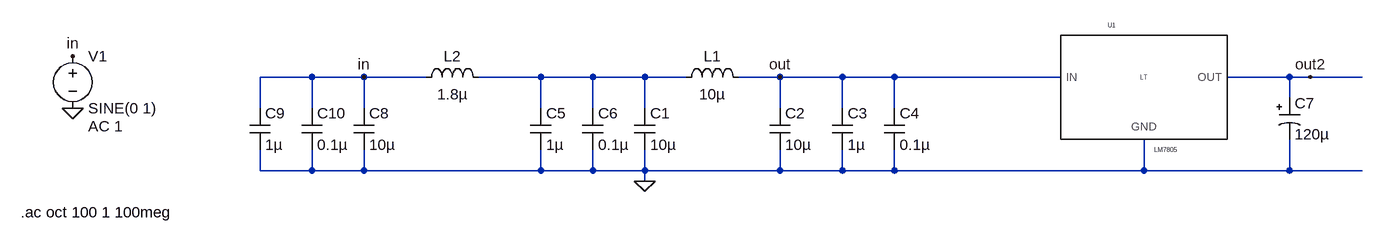
[diagram p0: schematic CLC_pi_filter.asc]
CLC_pi_filter.asc, the LTspice schematic file:
Version 4
SHEET 1 1236 680
WIRE -384 80 -464 80
WIRE -304 80 -384 80
WIRE -208 80 -304 80
WIRE -32 80 -128 80
WIRE 48 80 -32 80
WIRE 128 80 48 80
WIRE 192 80 128 80
WIRE 336 80 272 80
WIRE 432 80 336 80
WIRE 512 80 432 80
WIRE 768 80 512 80
WIRE 1120 80 1024 80
WIRE 1152 80 1120 80
WIRE 1232 80 1152 80
WIRE 1120 112 1120 80
WIRE -464 128 -464 80
WIRE -384 128 -384 80
WIRE -304 128 -304 80
WIRE -32 128 -32 80
WIRE 48 128 48 80
WIRE 128 128 128 80
WIRE 336 128 336 80
WIRE 432 128 432 80
WIRE 512 128 512 80
WIRE -464 224 -464 192
WIRE -384 224 -384 192
WIRE -384 224 -464 224
WIRE -304 224 -304 192
WIRE -304 224 -384 224
WIRE -32 224 -32 192
WIRE -32 224 -304 224
WIRE 48 224 48 192
WIRE 48 224 -32 224
WIRE 128 224 128 192
WIRE 128 224 48 224
WIRE 336 224 336 192
WIRE 336 224 128 224
WIRE 432 224 432 192
WIRE 432 224 336 224
WIRE 512 224 512 192
WIRE 512 224 432 224
WIRE 896 224 896 176
WIRE 896 224 512 224
WIRE 1120 224 1120 176
WIRE 1120 224 896 224
WIRE 1232 224 1120 224
WIRE 128 240 128 224
FLAG 128 240 0
FLAG 336 80 out
FLAG -752 128 0
FLAG -752 48 in
FLAG 1152 80 out2
FLAG -304 80 in
SYMBOL cap 112 128 R0
SYMATTR InstName C1
SYMATTR Value 10µ
SYMATTR SpiceLine V=10 Irms=7.86 Rser=0.00457925 Lser=0 mfg="KEMET" pn="C1206C106K8RAC" type="X7R"
SYMBOL ind 176 96 R270
WINDOW 0 32 56 VTop 2
WINDOW 3 5 56 VBottom 2
SYMATTR InstName L1
SYMATTR Value 10µ
SYMATTR SpiceLine Ipk=1.44 Rser=0.1 Rpar=0 Cpar=0
SYMBOL cap 320 128 R0
SYMATTR InstName C2
SYMATTR Value 10µ
SYMATTR SpiceLine V=10 Irms=13.8 Rser=0.00468332 Lser=0 mfg="KEMET" pn="C1210C106K8RAC" type="X7R"
SYMBOL voltage -752 32 R0
WINDOW 123 24 124 Left 2
WINDOW 39 0 0 Left 2
SYMATTR InstName V1
SYMATTR Value SINE(0 1)
SYMATTR Value2 AC 1
SYMBOL cap 416 128 R0
SYMATTR InstName C3
SYMATTR Value 1µ
SYMATTR SpiceLine V=10 Irms=5.18 Rser=0.0171188 Lser=0 mfg="KEMET" pn="C0603C105K8PAC" type="X5R"
SYMBOL cap 496 128 R0
SYMATTR InstName C4
SYMATTR Value 0.1µ
SYMATTR SpiceLine V=10 Irms=728m Rser=0.14361 Lser=0 mfg="KEMET" pn="C0603C104K8RAC" type="X7R"
SYMBOL cap -48 128 R0
SYMATTR InstName C5
SYMATTR Value 1µ
SYMATTR SpiceLine V=10 Irms=5.18 Rser=0.0171188 Lser=0 mfg="KEMET" pn="C0603C105K8PAC" type="X5R"
SYMBOL cap 32 128 R0
SYMATTR InstName C6
SYMATTR Value 0.1µ
SYMATTR SpiceLine V=10 Irms=728m Rser=0.14361 Lser=0 mfg="KEMET" pn="C0603C104K8RAC" type="X7R"
SYMBOL my\\7805 896 80 R0
SYMATTR InstName U1
SYMBOL polcap 1104 112 R0
WINDOW 3 24 56 Left 2
SYMATTR InstName C7
SYMATTR Value 120µ
SYMATTR Description Capacitor
SYMATTR Type cap
SYMATTR SpiceLine V=63 Irms=750m Rser=0.12 Lser=0 mfg="Nichicon" pn="UPL1J121MRH6" type="Al electrolytic"
SYMBOL ind -224 96 R270
WINDOW 0 32 56 VTop 2
WINDOW 3 5 56 VBottom 2
SYMATTR InstName L2
SYMATTR Value 1.8µ
SYMATTR SpiceLine Ipk=2.91 Rser=0.042 Rpar=0 Cpar=0 mfg="Sumida" pn="CD43-1R8"
SYMBOL cap -320 128 R0
SYMATTR InstName C8
SYMATTR Value 10µ
SYMATTR SpiceLine V=10 Irms=7.86 Rser=0.00457925 Lser=0 mfg="KEMET" pn="C1206C106K8RAC" type="X7R"
SYMBOL cap -480 128 R0
SYMATTR InstName C9
SYMATTR Value 1µ
SYMATTR SpiceLine V=10 Irms=5.18 Rser=0.0171188 Lser=0 mfg="KEMET" pn="C0603C105K8PAC" type="X5R"
SYMBOL cap -400 128 R0
SYMATTR InstName C10
SYMATTR Value 0.1µ
SYMATTR SpiceLine V=10 Irms=728m Rser=0.14361 Lser=0 mfg="KEMET" pn="C0603C104K8RAC" type="X7R"
TEXT -832 288 Left 2 !.ac oct 100 1 100meg

The netlist it stands for:
* CLC_pi_filter.asc
C1 N001 0 10µ V=10 Irms=7.86 Rser=0.00457925 Lser=0 mfg="KEMET" pn="C1206C106K8RAC" type="X7R"
L1 N001 out 10µ Ipk=1.44 Rser=0.1 Rpar=0 Cpar=0
C2 out 0 10µ V=10 Irms=13.8 Rser=0.00468332 Lser=0 mfg="KEMET" pn="C1210C106K8RAC" type="X7R"
V1 in 0 SINE(0 1) AC 1
C3 out 0 1µ V=10 Irms=5.18 Rser=0.0171188 Lser=0 mfg="KEMET" pn="C0603C105K8PAC" type="X5R"
C4 out 0 0.1µ V=10 Irms=728m Rser=0.14361 Lser=0 mfg="KEMET" pn="C0603C104K8RAC" type="X7R"
C5 N001 0 1µ V=10 Irms=5.18 Rser=0.0171188 Lser=0 mfg="KEMET" pn="C0603C105K8PAC" type="X5R"
C6 N001 0 0.1µ V=10 Irms=728m Rser=0.14361 Lser=0 mfg="KEMET" pn="C0603C104K8RAC" type="X7R"
XU1 out 0 out2 LM7805  ; pins IN GND OUT
C7 out2 0 120µ V=63 Irms=750m Rser=0.12 Lser=0 mfg="Nichicon" pn="UPL1J121MRH6" type="Al electrolytic"
L2 in N001 1.8µ Ipk=2.91 Rser=0.042 Rpar=0 Cpar=0 mfg="Sumida" pn="CD43-1R8"
C8 in 0 10µ V=10 Irms=7.86 Rser=0.00457925 Lser=0 mfg="KEMET" pn="C1206C106K8RAC" type="X7R"
C9 in 0 1µ V=10 Irms=5.18 Rser=0.0171188 Lser=0 mfg="KEMET" pn="C0603C105K8PAC" type="X5R"
C10 in 0 0.1µ V=10 Irms=728m Rser=0.14361 Lser=0 mfg="KEMET" pn="C0603C104K8RAC" type="X7R"
.ac oct 100 1 100meg
.lib regulators.lib
.backanno
.end